# Altium schematic sheet Sensor.SchDoc
size A4; SheetNumber: 6; SheetTotal: 12
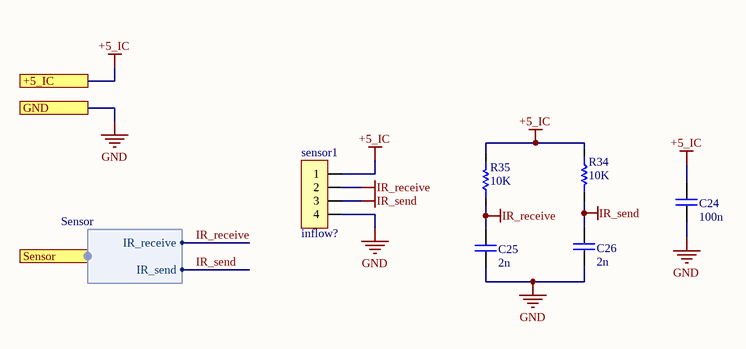
[diagram p0: Sensor.SchDoc]

## Parts
C24  100n  [CAP 1206/3216]
C25  2n  [CAP 1206/3216]
C26  2n  [CAP 1206/3216]
R34  10K  [RES 1206 (3216X08L)]
R35  10K  [RES 1206 (3216X08L)]
sensor1  Inflow: inflow?  [MOLEX KK 0022272041]  (hidden comment: 4'Pin)

## Ports
+5_IC, GND, Sensor (harness Sensor)

## Harnesses
Sensor: IR_receive, IR_send

## Nets
+5_IC: C24.1 R34.1 R35.2 sensor1.1 ; port +5_IC
GND: C24.2 C25.2 C26.2 sensor1.4 ; port GND
IR_receive: C25.1 R35.1 sensor1.2 ; port Sensor.IR_receive
IR_send: C26.1 R34.2 sensor1.3 ; port Sensor.IR_send

## Library data of the parts
C24-C26 = Cap_Multi_SMD_100nF_1206: Bipolar ceramic capacitor SMD; Type: MultiLayer; Inflow: inflow?; Rating: 50V; Validation: Valid; Package: 1206
  C24: Value: 100n
  C25 C26: Value: 2n
R34 R35 = Res_SMD_1206: Resistor; Inflow: inflow?; Rating: 0.25W; Validation: Valid; Package: 1206; Type: 10%; Value: 10K
sensor1 = Con_Signal_4: Signal Connector 4'Pin; Rating: Rating?; Validation: Valid; Value: 4'Pin; Package: Package?; Type: Type?